# EasyEDA Pro project ProPrj_RUSH - SATURN - v8_2026-11-14.epro

# Board PCB1
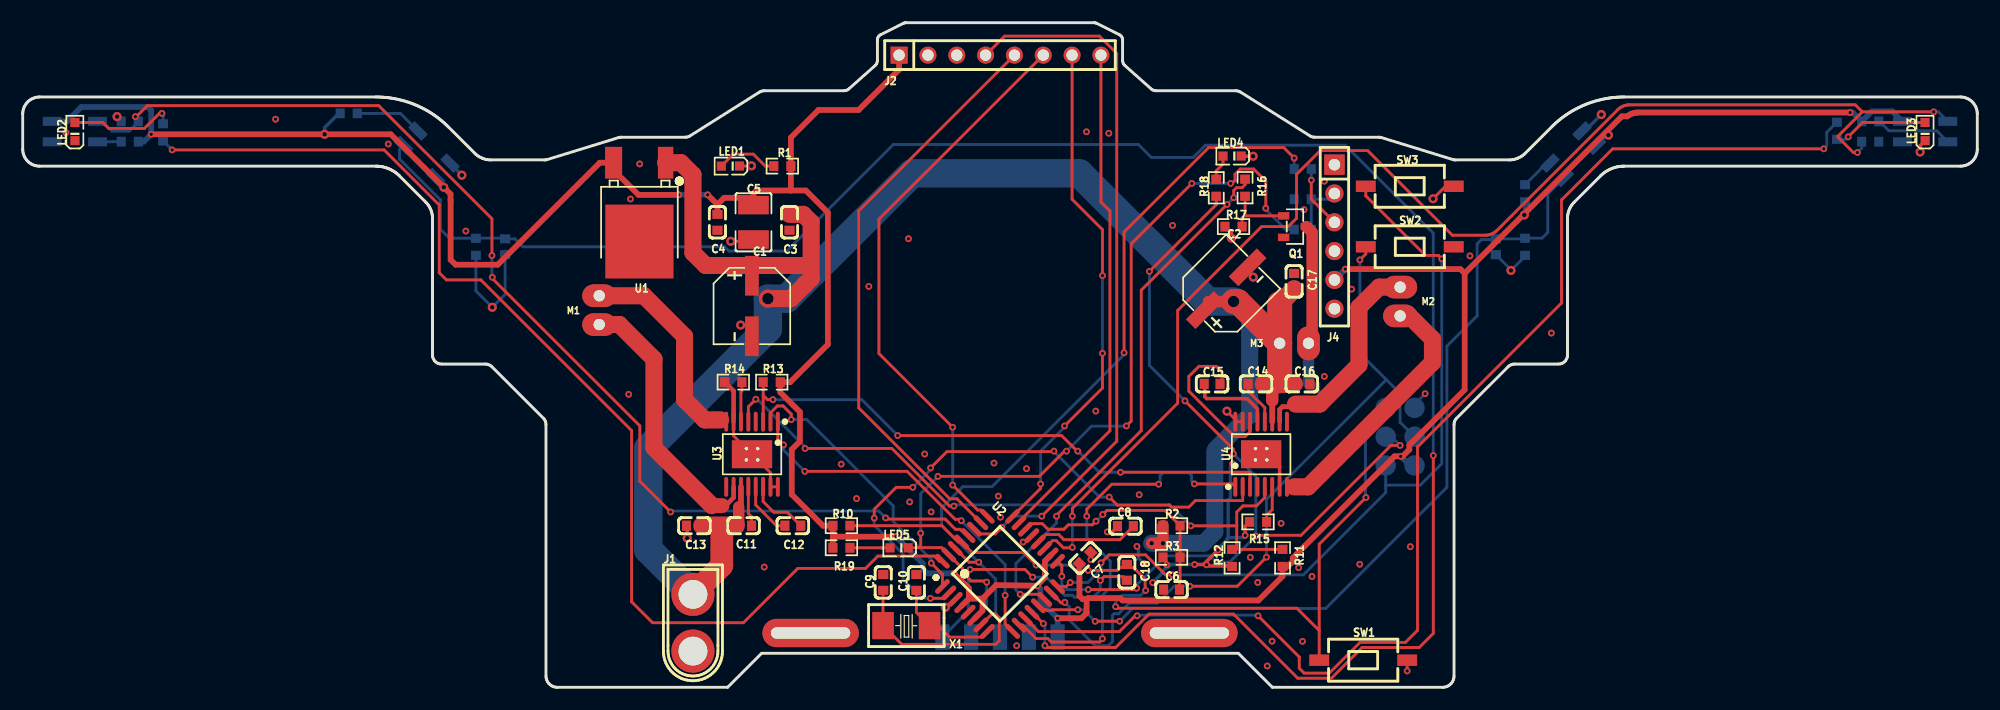
[diagram p0: board, top side]
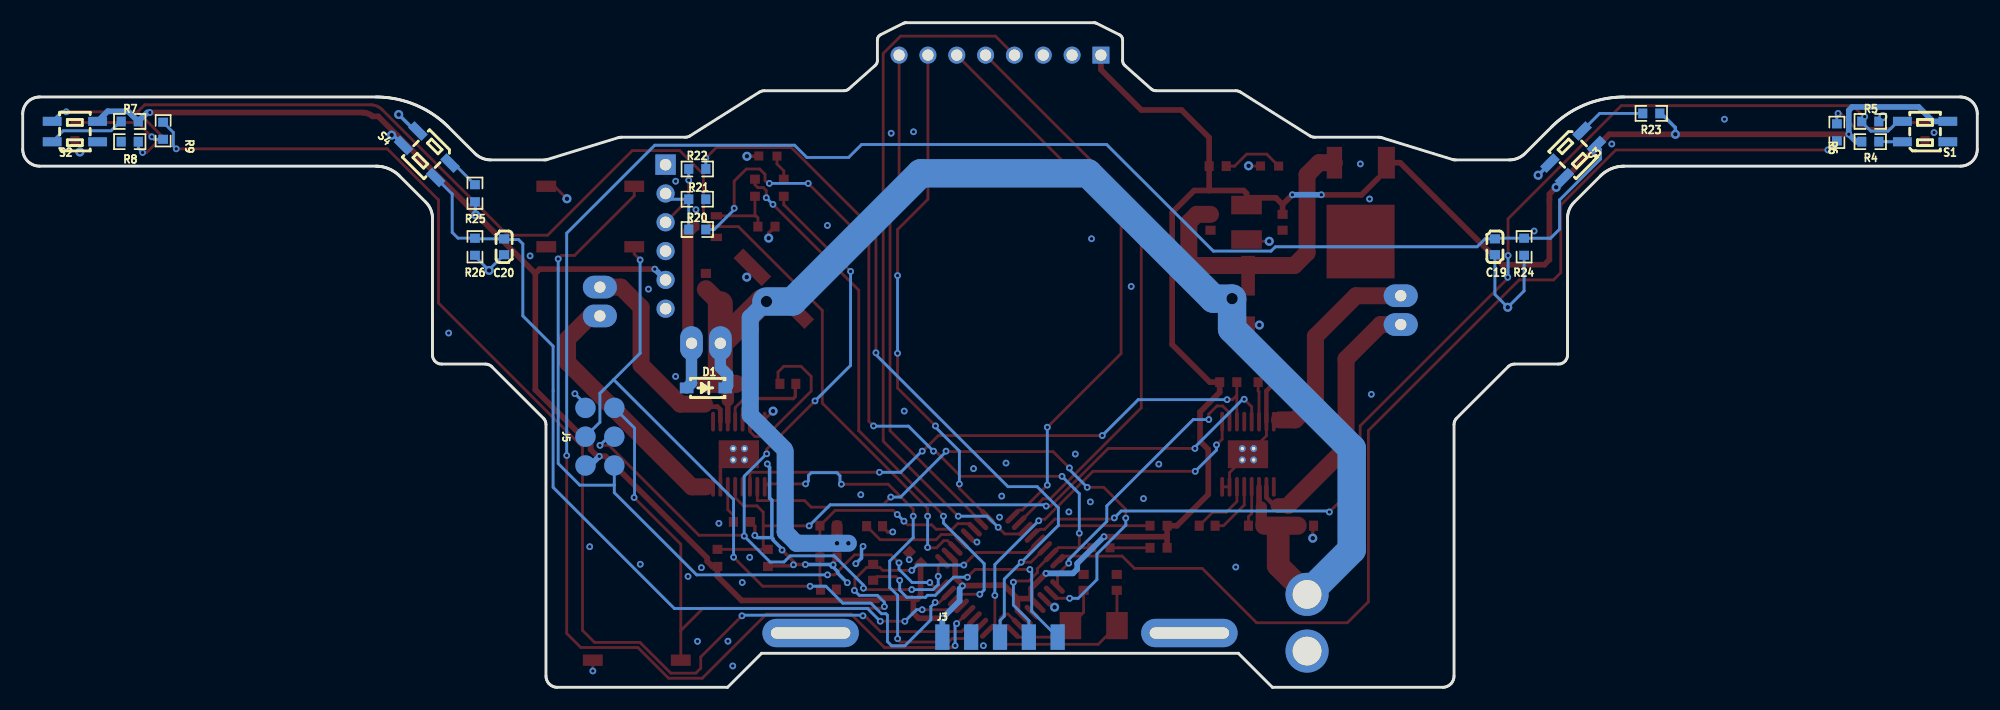
[diagram p1: board, bottom side, seen from below]

Outline 172.2 x 58.6 mm; copper layers: Top Layer, Bottom Layer. Coordinates in mm from the lower left corner of the outline.
Outline path: 0,50.55 0.01,50.7 0.03,50.84 0.06,50.99 0.11,51.12 0.18,51.26 0.25,51.38 0.34,51.5 0.44,51.61 0.55,51.71 0.67,51.8 0.79,51.87 0.93,51.94 1.06,51.99 1.21,52.02 1.35,52.04 1.5,52.05 31.12,52.05 31.23,52.05 31.34,52.05 31.45,52.04 31.56,52.04 31.67,52.03 31.78,52.03 31.89,52.02 32,52.01 32.11,52 32.22,51.98 32.33,51.97 32.44,51.95 32.55,51.94 32.66,51.92 32.77,51.9 32.88,51.88 32.99,51.85 33.1,51.83 33.21,51.81 33.31,51.78 33.42,51.75 33.53,51.72 33.64,51.69 33.74,51.66 33.85,51.63 33.95,51.59 34.06,51.56 34.16,51.52 34.27,51.48 34.37,51.44 34.48,51.4 34.58,51.36 34.68,51.32 34.78,51.27 34.88,51.23 34.98,51.18 35.08,51.13 35.18,51.08 35.28,51.03 35.38,50.98 35.48,50.93 35.58,50.87 35.67,50.82 35.77,50.76 35.86,50.7 35.96,50.65 36.05,50.59 36.14,50.53 36.23,50.46 36.33,50.4 36.42,50.33 36.51,50.27 36.59,50.2 36.68,50.13 36.77,50.07 36.86,50 36.94,49.92 37.03,49.85 37.11,49.78 37.19,49.71 37.27,49.63 37.35,49.55 37.43,49.48 37.51,49.4 39.83,47.09 39.92,47 40.02,46.91 40.13,46.84 40.24,46.77 40.36,46.71 40.48,46.65 40.6,46.61 40.72,46.57 40.85,46.54 40.98,46.52 41.11,46.5 41.24,46.5 45.98,46.5 46.1,46.51 46.21,46.53 52.49,48.47 52.6,48.49 52.72,48.5 58.37,48.5 58.52,48.51 58.66,48.56 58.8,48.62 64.9,52.48 65.04,52.54 65.18,52.59 65.33,52.6 72.37,52.6 72.52,52.62 72.65,52.67 72.77,52.75 75.1,54.82 75.21,54.95 75.28,55.1 75.3,55.27 75.3,57.09 75.33,57.27 75.43,57.43 75.58,57.54 77.59,58.55 77.7,58.59 77.82,58.6 94.38,58.6 94.5,58.59 94.61,58.55 96.62,57.54 96.77,57.43 96.87,57.27 96.9,57.09 96.9,55.27 96.92,55.1 96.99,54.95 97.1,54.82 99.43,52.75 99.55,52.67 99.68,52.62 99.83,52.6 106.87,52.6 107.02,52.59 107.16,52.54 107.3,52.48 113.4,48.62 113.54,48.56 113.68,48.51 113.83,48.5 119.48,48.5 119.6,48.49 119.72,48.47 125.98,46.53 126.1,46.51 126.22,46.5 130.96,46.5 131.09,46.5 131.22,46.52 131.35,46.54 131.48,46.57 131.6,46.61 131.72,46.65 131.84,46.71 131.96,46.77 132.07,46.84 132.18,46.91 132.28,47 132.37,47.09 134.69,49.4 134.76,49.48 134.84,49.55 134.93,49.63 135.01,49.71 135.09,49.78 135.17,49.85 135.26,49.92 135.34,50 135.43,50.07 135.52,50.13 135.61,50.2 135.69,50.27 135.78,50.33 135.87,50.4 135.97,50.46 136.06,50.53 136.15,50.59 136.24,50.65 136.34,50.7 136.43,50.76 136.53,50.82 136.62,50.87 136.72,50.93 136.82,50.98 136.92,51.03 137.02,51.08 137.12,51.13 137.22,51.18 137.32,51.23 137.42,51.27 137.52,51.32 137.62,51.36 137.72,51.4 137.83,51.44 137.93,51.48 138.04,51.52 138.14,51.56 138.25,51.59 138.35,51.63 138.46,51.66 138.56,51.69 138.67,51.72 138.78,51.75 138.89,51.78 138.99,51.81 139.1,51.83 139.21,51.85 139.32,51.88 139.43,51.9 139.54,51.92 139.65,51.94 139.76,51.95 139.87,51.97 139.98,51.98 140.09,52 140.2,52.01 140.31,52.02 140.42,52.03 140.53,52.03 140.64,52.04 140.75,52.04 140.86,52.05 140.97,52.05 141.09,52.05 170.7,52.05 170.85,52.04 170.99,52.02 171.14,51.99 171.27,51.94 171.41,51.87 171.53,51.8 171.65,51.71 171.76,51.61 171.86,51.5 171.95,51.38 172.02,51.26 172.09,51.12 172.14,50.99 172.17,50.84 172.19,50.7 172.2,50.55 172.2,47.45 172.19,47.3 172.17,47.16 172.14,47.01 172.09,46.88 172.02,46.74 171.95,46.62 171.86,46.5 171.76,46.39 171.65,46.29 171.53,46.2 171.41,46.13 171.27,46.06 171.14,46.01 170.99,45.98 170.85,45.96 170.7,45.95 141.09,45.95 141.03,45.95 140.95,45.95 140.88,45.94 140.81,45.94 140.7,45.92 140.59,45.91 140.5,45.89 140.39,45.87 140.29,45.84 140.21,45.82 140.1,45.78 140,45.74 139.91,45.71 139.81,45.66 139.72,45.61 139.62,45.56 139.53,45.5 139.46,45.46 139.37,45.4 139.28,45.33 139.2,45.27 139.14,45.22 139.07,45.15 139,45.09 136.69,42.77 136.6,42.68 136.51,42.58 136.44,42.47 136.37,42.36 136.31,42.24 136.25,42.12 136.21,42 136.17,41.88 136.14,41.75 136.12,41.62 136.1,41.49 136.1,41.36 136.1,29.3 136.08,29.12 136.02,28.95 135.92,28.8 135.8,28.67 135.65,28.58 135.48,28.52 135.3,28.5 131.43,28.5 131.28,28.48 131.12,28.44 130.99,28.36 130.87,28.27 126.33,23.73 126.23,23.61 126.16,23.47 126.11,23.33 126.1,23.17 126.1,1 126.09,0.83 126.04,0.66 125.97,0.5 125.87,0.36 125.74,0.23 125.6,0.13 125.44,0.06 125.27,0.01 125.1,0 110.1,0 107.1,3 65.1,3 62.1,0 47.1,0 46.93,0.01 46.76,0.06 46.6,0.13 46.46,0.23 46.33,0.36 46.23,0.5 46.16,0.66 46.12,0.83 46.1,1 46.1,23.17 46.09,23.33 46.04,23.47 45.96,23.61 45.87,23.73 41.33,28.27 41.21,28.36 41.07,28.44 40.93,28.48 40.77,28.5 36.9,28.5 36.72,28.52 36.55,28.58 36.4,28.67 36.27,28.8 36.18,28.95 36.12,29.12 36.1,29.3 36.1,41.36 36.1,41.49 36.08,41.62 36.06,41.75 36.03,41.88 35.99,42 35.95,42.12 35.89,42.24 35.83,42.36 35.76,42.47 35.69,42.58 35.6,42.68 35.51,42.77 33.2,45.09 33.13,45.15 33.06,45.22 33,45.27 32.92,45.33 32.85,45.38 32.76,45.45 32.67,45.5 32.58,45.56 32.49,45.61 32.4,45.66 32.3,45.7 32.22,45.73 32.12,45.77 32.03,45.81 31.92,45.84 31.82,45.86 31.71,45.89 31.63,45.9 31.52,45.92 31.43,45.93 31.36,45.94 31.27,45.95 31.2,45.95 31.11,45.95 1.5,45.95 1.35,45.96 1.21,45.98 1.06,46.01 0.93,46.06 0.79,46.13 0.67,46.2 0.55,46.29 0.44,46.39 0.34,46.5 0.25,46.62 0.18,46.74 0.11,46.88 0.06,47.01 0.03,47.16 0.01,47.3 0,47.45 0,50.55
Stack: Top Layer 0.035mm / Dielectric1 1.51mm FR4 er 4.5 / Bottom Layer 0.035mm

## Design rules (mm)
spacing copperThickness1oz (default): track to track 0.2, other pairs 0.2 to 0.3
spacing copperThickness2oz: track to track 0.203, other pairs 0.152 to 0.3
spacing Plane_innerPlane: track to track 0.2, other pairs 0.2 to 0.3
spacing Copper_copperRegion: track to track 0.2, other pairs 0.2 to 0.3
track width copperThickness1oz (default): min 0.25, default 0.25, max 3
track width copperThickness2oz: min 0.203, default 0.254, max 2.54
differential pair differentialPair (default): width min 0.127, default 0.254, max 2.54; gap min 0.152, default 0.152
net GND uses Copper_copperRegion, Plane_innerPlane
pour e1803 uses Copper_copperRegion
pour e1804 uses Copper_copperRegion

## Placement (name value [footprint] x y rotation side)
C1  220uF  [CAP-SMD_BD6.3-L6.6-W6.6-FD]  64.24 33.62 270 top
C2  220uF  [CAP-SMD_BD6.3-L6.6-W6.6-FD]  106.02 35.14 45 top
C3  220nF  [C0603]  67.56 41 270 top
C4  100nF  [C0603]  61.21 41 270 top
C5  47uF  [C1210]  64.38 41 90 top
C6  100nF  [C0603]  101.21 8.62 180 top
C7  100nF  [C0603]  93.59 11.41 45 top
C8  100nF  [C0603]  97.15 14.2 180 top
C9  22pF  [C0603]  75.81 9.25 90 top
C10  22pF  [C0603]  78.73 9.25 90 top
C11  100nF  [C0603]  63.51 14.25 0 top
C12  22nF  [C0603]  67.85 14.25 0 top
C13  100nF  [C0603]  59.18 14.25 180 top
C14  100nF  [C0603]  108.66 26.75 180 top
C15  22nF  [C0603]  104.79 26.75 0 top
C16  100nF  [C0603]  112.69 26.75 0 top
C17  100nF  [C0603]  112.01 35.79 90 top
C18  100nF  [C0603]  97.28 10.14 90 top
C19  10nF  [C0603]  42.5 38.84 90 bottom
C20  10nF  [C0603]  129.79 38.84 90 bottom
D1  1N5819  [SOD-123_L2.7-W1.6-LS3.7-RD-1]  112.01 26.4 0 bottom
J1  XT30 (bateria 2S)  [CONN-TH_XT30U-M]  59.05 5.69 270 top
J2  BARRA (1x8, 2,54 mm)  [HDR-TH_8P-P2.54-V-M]  86.1 55.74 0 top
J3  -  [seguidor_alpha:HDR_1x05_P2.54_SMD_DEITADA]  86.1 4.43 0 bottom
J4  -  [HDR-TH_6P-P2.54-V-F]  115.56 39.73 270 top
J5  -  [seguidor_alpha:ICSP_6P_SMD_BOT]  121.35 22.1 0 bottom
LED1  verde  [LED0603-RD_GREEN]  62.35 45.96 180 top
LED2  LED A  [LED0603-RD_GREEN]  4.6 49 90 top
LED3  LED B  [LED0603-RD_GREEN]  167.6 49 90 top
LED4  LED C  [LED0603-RD_GREEN]  106.55 46.84 180 top
LED5  TX  [LED0603-RD_GREEN]  77.21 12.3 180 top
M1  1020 esq.  [seguidor_alpha:MOTOR_1020_2P]  50.79 33.25 0 top
M2  1020 dir.  [seguidor_alpha:MOTOR_1020_2P]  121.35 34.02 180 top
M3  ventoinha  [seguidor_alpha:MOTOR_1020_2P]  112.01 30.33 270 top
NOREF  -  [Pad_e303]  102.78 4.79 270 top
NOREF#2  -  [Pad_e304]  69.41 4.79 270 top
Q1  AO3400A  [SOT-23-3_L2.9-W1.3-P1.90-LS2.4-BR]  112.09 40.62 180 top
R1  1k  [R0603]  66.92 45.95 180 top
R2  -  [R0603]  101.21 14.25 0 top
R3  -  [R0603]  101.21 11.46 180 top
R4  220  [R0603]  9.43 48.11 180 bottom
R5  47k  [R0603]  9.43 49.89 180 bottom
R6  1k  [R0603]  12.37 48.93 90 bottom
R7  220  [R0603]  162.77 49.89 0 bottom
R8  47k  [R0603]  162.77 48.11 0 bottom
R9  1k  [R0603]  159.83 49.07 270 bottom
R10  10k  [R0603]  72.13 14.25 0 top
R11  15k 1%  [R0603]  110.99 11.41 90 top
R12  10k 1%  [R0603]  106.55 11.41 270 top
R13  10k  [R0603]  65.99 26.91 180 top
R14  1.5k 1%  [R0603]  62.6 26.91 180 top
R15  1.5k 1%  [R0603]  108.83 14.58 180 top
R16  200  [R0603]  107.69 44.05 270 top
R17  10k  [R0603]  106.67 40.62 180 top
R18  1k  [R0603]  105.15 44.04 90 top
R19  1k  [R0603]  72.13 12.3 0 top
R20  1k  [R0603]  112.77 40.37 0 bottom
R21  2k  [R0603]  112.77 43.03 180 bottom
R22  4.7k  [R0603]  112.77 45.7 0 bottom
R23  220  [R0603]  28.72 50.6 0 bottom
R24  47k  [R0603]  39.93 38.84 270 bottom
R25  220  [R0603]  132.36 43.56 90 bottom
R26  47k  [R0603]  132.36 38.84 270 bottom
S1  QRE1113GR  [OPTO-SMD_QRE1113GR]  4.6 49 180 bottom
S2  QRE1113GR  [OPTO-SMD_QRE1113GR]  167.6 49 180 bottom
S3  QRE1113GR  [OPTO-SMD_QRE1113GR]  35.6 47 315 bottom
S4  QRE1113GR  [OPTO-SMD_QRE1113GR]  136.6 47 45 bottom
SW1  RESET  [KEY-SMD_L6.1-W3.7-LS8.0-2]  118.1 2.39 180 top
SW2  BOTÃO 1  [KEY-SMD_L6.1-W3.7-LS8.0-2]  122.2 38.84 0 top
SW3  BOTÃO 2  [KEY-SMD_L6.1-W3.7-LS8.0-2]  122.2 44.18 0 top
U1  78M05  [TO-252-2_L6.5-W6.1-P4.58-LS10.0-TL]  54.35 42.78 270 top
U2  ATmega328P-AU  [TQFP-32_L7.0-W7.0-P0.80-LS9.0-BL]  86.1 10 315 top
U3  DRV8874PWPR  [HTSSOP-16_L5.0-W4.4-P0.65-LS6.4-BL-EP]  64.25 20.55 180 top
U4  DRV8874PWPR  [HTSSOP-16_L5.0-W4.4-P0.65-LS6.4-BL-EP]  109.11 20.55 0 top
X1  16MHz  [CRYSTAL-SMD_L5.0-W3.2]  77.84 5.44 0 top

## Footprints (pads in the part's own frame, mm; a bottom-side part is the same pattern mirrored in y, then rotated)
C0603
  rect 0.8x0.9 smd: 1(-0.7,0) 2(0.7,0)
C1210
  rect 1.635x2.7 smd: 1(-1.518,0) 2(1.518,0)
CAP-SMD_BD6.3-L6.6-W6.6-FD
  rect 3.5x1.2 smd: 1(-2.67,0) 2(2.67,0)
CONN-TH_XT30U-M
  round 3.8 hole 2.54: 1(-2.5,0) 2(2.5,0)
CRYSTAL-SMD_L5.0-W3.2
  rect 1.9x2.4 smd: 1(-2.05,0) 2(2.05,0)
HDR-TH_6P-P2.54-V-F
  rect 1.8x1.8 hole 1.02: 1(-6.35,0)
  round 1.6 hole 1.02: 2(-3.81,0) 3(-1.27,0) 4(1.27,0) 5(3.81,0) 6(6.35,0)
HDR-TH_8P-P2.54-V-M
  rect 1.5x1.5 hole 1: 1(-8.89,0)
  round 1.5 hole 1: 2(-6.35,0) 3(-3.81,0) 4(-1.27,0) 5(1.27,0) 6(3.81,0) 7(6.35,0) 8(8.89,0)
HTSSOP-16_L5.0-W4.4-P0.65-LS6.4-BL-EP
  oval 0.343x1.746 smd: 1(-2.275,-2.873) 2(-1.625,-2.873) 3(-0.975,-2.873) 4(-0.325,-2.873) 5(0.325,-2.873) 6(0.975,-2.873) 7(1.625,-2.873) 8(2.275,-2.873) 9(2.275,2.873) 10(1.625,2.873) 11(0.975,2.873) 12(0.325,2.873) 13(-0.325,2.873) 14(-0.975,2.873) 15(-1.625,2.873) 16(-2.275,2.873)
  round 0.61 hole 0.305: 17(-0.5,0.5) 17(-0.5,-0.5) 17(0.5,0.5) 17(0.5,-0.5)
  rect 3.55x2.46 smd: 17(0,0)
KEY-SMD_L6.1-W3.7-LS8.0-2
  rect 1.75x1 smd: 1(-3.875,0) 2(3.875,0)
LED0603-RD_GREEN
  rect 0.8x0.8 smd: 1(-0.799,-0.004) 2(0.799,0.004)
OPTO-SMD_QRE1113GR
  rect 1.66x0.8 smd: 1(-2,-0.9) 2(2,-0.9) 3(2,0.9) 4(-2,0.9)
Pad_e303
  oval 2.5x8.5 hole 1x7: 1(0,0)
Pad_e304
  oval 2.5x8.5 hole 1x7: 1(0,0)
R0603
  rect 0.806x0.864 smd: 1(-0.753,0) 2(0.753,0)
seguidor_alpha:HDR_1x05_P2.54_SMD_DEITADA
  rect 1.25x2.25 smd: 1(5.08,0) 2(2.54,0) 3(0,0) 4(-2.54,0) 5(-5.08,0)
seguidor_alpha:ICSP_6P_SMD_BOT
  round 1.8 smd: 1(-1.27,2.54) 2(1.27,2.54) 3(-1.27,0) 4(1.27,0) 5(-1.27,-2.54) 6(1.27,-2.54)
seguidor_alpha:MOTOR_1020_2P
  oval 3x2 hole 1: 1(0,-1.27) 2(0,1.27)
SOD-123_L2.7-W1.6-LS3.7-RD-1
  rect 1.2x0.95 smd: 1(-1.7,0) 2(1.7,0)
SOT-23-3_L2.9-W1.3-P1.90-LS2.4-BR
  rect 1x0.65 smd: 1(1,-0.95) 2(1,0.95) 3(-1,0)
TO-252-2_L6.5-W6.1-P4.58-LS10.0-TL
  rect 2.8x1.35 smd: 1(-3.475,2.29)
  rect 6.5x6 smd: 2(3.475,-0.017)
  rect 2.8x1.5 smd: 3(-3.475,-2.29)
TQFP-32_L7.0-W7.0-P0.80-LS9.0-BL
  oval 0.45x1.65 smd: 1(-2.8,-4.369) 2(-2,-4.369) 3(-1.2,-4.369) 4(-0.4,-4.369) 5(0.4,-4.369) 6(1.2,-4.369) 7(2,-4.369) 8(2.8,-4.369) 17(2.8,4.369) 18(2,4.369) 19(1.2,4.369) 20(0.4,4.369) 21(-0.4,4.369) 22(-1.2,4.369) 23(-2,4.369) 24(-2.8,4.369)
  oval 1.65x0.45 smd: 9(4.381,-2.8) 10(4.381,-2) 11(4.381,-1.2) 12(4.381,-0.4) 13(4.381,0.4) 14(4.381,1.2) 15(4.381,2) 16(4.381,2.8) 25(-4.381,2.8) 26(-4.381,2) 27(-4.381,1.2) 28(-4.381,0.4) 29(-4.381,-0.4) 30(-4.381,-1.2) 31(-4.381,-2) 32(-4.381,-2.8)

## Nets
+5V: C4.1 C5.2 C7.1 J2.1 J3.1 J4.5 J5.2 R1.1 R4.1 R7.1 R10.1 R11.1 R13.1 R19.1 R23.1 R25.1 S1.3 S2.3 S3.3 S4.3 U1.3 U2.4 U2.6 U2.18
GND: C1.2 C2.2 C3.2 C4.2 C5.1 C6.2 C7.2 C8.2 C9.2 C10.2 C13.2 C16.2 C17.2 C19.1 C20.1 J1.2 J2.2 J3.2 J4.4 J5.6 LED1.1 LED2.1 LED3.1 LED4.1 Q1.2 R3.2 R5.2 R8.2 R12.2 R14.2 R15.2 R17.2 R21.2 R24.2 R26.2 S1.2 S2.2 S3.2 S4.2 SW1.1 SW2.2 SW3.2 U1.2 U2.3 U2.5 U2.21 U3.7 U3.9 U3.15 U3.16 U3.17 U4.7 U4.9 U4.15 U4.16 U4.17
VBAT: C1.1 C2.1 C3.1 C11.1 C13.1 C14.1 C16.1 C17.1 D1.1 J1.1 M3.1 R2.1 U1.1 U3.11 U4.11
VBAT_A7: C6.1 R2.2 R3.1 U2.22
AREF: C8.1 U2.20
B1_D11: J5.4 SW2.1 U2.15
B2_D12: J5.1 SW3.1 U2.16
BT_RXD: J4.2 R20.2 R21.1
BT_TXD: J4.3 R22.2
C0_A4: J2.4 U2.27
CPH_A: C12.1 U3.13
CPH_B: C15.1 U4.13
CPL_A: C12.2 U3.14
CPL_B: C15.2 U4.14
DIRA_D3: U2.1 U3.2
DIRB_D4: U2.2 U4.2
DRV_SLEEP: R13.2 U3.3 U4.3
DTR: C18.1 J3.5
IPROPI_A: R14.1 U3.6
IPROPI_B: R15.1 U4.6
LEDA_D2: R6.1 U2.32
LEDB_D7: R9.1 U2.11
LEDC_D13: J5.3 R18.1 U2.17
MARK_L2_D8: C19.2 R24.1 S3.4 U2.12
MARK_L_A5: R5.1 S1.4 U2.28
MARK_R2_D9: C20.2 R26.1 S4.4 U2.13
MARK_R_A6: R8.1 S2.4 U2.19
OUT_A1: M1.2 U3.8
OUT_A2: M1.1 U3.10
OUT_B1: M2.2 U4.8
OUT_B2: M2.1 U4.10
OUT_C: D1.2 M3.2 Q1.3
PWMA_D5: U2.9 U3.1
PWMB_D6: U2.10 U4.1
PWMC_D10: R16.1 U2.14
QRE_D1_A: R25.2 S4.1
QRE_E1_A: R23.2 S3.1
RESET: C18.2 J5.5 R10.2 SW1.2 U2.29
RX_D0: J3.3 R22.1 U2.30
S0_A0: J2.8 U2.23
S1_A1: J2.7 U2.24
S2_A2: J2.6 U2.25
S3_A3: J2.5 U2.26
TX_D1: J3.4 LED5.1 R20.1 U2.31
VCP_A: C11.2 U3.12
VCP_B: C14.2 U4.12
VREF: R11.2 R12.1 U3.5 U4.5
XTAL1: C9.1 U2.7 X1.1
XTAL2: C10.1 U2.8 X1.2
$1N2280: R4.2 S1.1
$1N2301: R7.2 S2.1
$1N2302: LED1.2 R1.2
$1N2305: LED2.2 R6.2
$1N2314: LED3.2 R9.2
$1N2361: LED4.2 R18.2
$1N2362: LED5.2 R19.2
$1N2451: Q1.1 R16.2 R17.1

Pads without a net: J2 3; J4 1 6; NOREF 1; NOREF#2 1; U3 4; U4 4

## Via types
v1: diameter 1.6, hole 1, Top Layer to Bottom Layer, 2 vias
v2: diameter 0.8, hole 0.4, Top Layer to Bottom Layer, 22 vias
v3: diameter 0.6, hole 0.3, Top Layer to Bottom Layer, 160 vias

## Routing (per net, layer and track width the routed paths; a pad name or vN(x,y) marks a point on that pad's centre or on a via; arc(x,y) is an arc through that point)
+5V: length 298.2
  Top Layer w0.5: 52.77,44.9 54.26,43.41 57.78,43.41 v3(57.79,43.43) ; 127.04,36.5 127.04,26.24 122.16,21.36 122.16,20.96 121.57,20.37 v3(121.4,20.37) 120.85,20.37 111.89,11.4 111.89,11.11 111.44,10.66 R11.1 110.99,9.79 108.86,7.66 96.9,7.66 96.69,7.86 93.86,7.86 93.76,7.76 93.73,7.76 ; 127.04,36.5 140.88,50.34 141.36,50.34 141.48,50.43 141.61,50.5 141.74,50.57 141.88,50.62 142.02,50.65 142.17,50.67 142.32,50.68 161,50.68 ; 127.04,36.5 126.67,36.87 v3(116.51,36.87) ; 89.37,8.98 89.34,8.95 85.75,9.01 84.56,7.82 ; 89.37,8.98 v3(89.41,8.94) ; 89.37,8.98 90.05,9.67 90.05,11.12 U2.18 ; 71.38,13.28 R10.1 70.51,14.25 67.75,17 67.75,20.97 68.47,21.69 68.47,24.28 66.74,26.01 R13.1 67.61,26.91 70.93,30.23 70.93,41.87 69,43.8 67.68,43.8 ; 71.38,13.28 v3(76.94,13.28) ; 71.38,13.28 R19.1 ; 64.38,43.16 64.38,43.55 64.64,43.8 67.68,43.8 ; 64.38,43.16 61.8,43.16 61.21,42.57 C4.1 ; 64.38,43.16 64.38,42.52 ; v3(82.05,10.05) 82.05,10.04 83.35,8.74 83.35,7.82 ; J2.1 77.21,54.46 73.65,50.91 70.11,50.91 67.68,48.47 R1.1 67.68,43.8 ; U1.3 50.84,46.25 41.85,37.26 ; 84.56,7.82 84.56,6.76 U2.6 ; 84.56,7.82 83.35,7.82 ; 93.73,7.76 93.39,7.76 93.1,8.05 C7.1 ; 93.73,7.76 93.73,6.6 93.71,6.57 93.71,6.53 93.27,6.09 v3(91.18,6.09) ; 83.35,7.82 U2.4 ; v3(60.34,43.43) 61.07,42.7 ; 11.32,48.76 v2(26.6,48.76) 32.43,48.76 v2(37.1,44.09) 37.69,43.49 37.69,43.01 37.7,42.86 37.7,37.7 38.14,37.26 41.85,37.26
  Bottom Layer w0.3: v2(26.6,48.76) 26.6,49.35 27.85,50.6 ; v2(139.7,48.69) 139.56,48.69 138.65,47.78 ; 36.38,44.95 37.1,44.23 v2(37.1,44.09) ; v2(132.29,41.65) 132.32,41.68 132.32,42.67
  Bottom Layer w0.5: v3(76.94,13.28) 79.3,10.92 79.3,10.42 79.67,10.05 v3(82.05,10.05) ; v3(116.51,36.87) J4.5 ; S2.3 164.71,50.79 162.92,50.79 R7.1 161.23,50.68 v3(161,50.68) ; J5.2 122.21,19.56 v3(121.4,20.37) ; v3(89.41,8.94) 89.66,8.7 89.66,7.61 v3(91.18,6.09) J3.1 ; R4.1 10.67,48.11 v3(11.32,48.76) 11.32,50.87 11.02,51.17 5.16,51.17 3.9,49.9 S1.3 ; v3(57.79,43.43) v3(60.34,43.43)
GND: length 64.8
  Top Layer w0.25: SW3.2 125.35,44.18 v2(124.25,43.08) ; C5.1 64.22,39.32 v2(62.38,39.32) ; v2(64.2,45.98) 64.18,45.96 63.15,45.96 ; 107.48,23.42 U4.16 106.83,23.61 v2(106.09,24.35) ; U3.16 U3.15 65.88,18.92 U3.17 U3.17 U3.17 62.63,22.17 U3.7 ; v3(121.97,1.44) SW1.1
  Top Layer w0.3: v3(107.7,13.4) 107.7,14.21 R15.2 ; 110.73,18.45 110.73,19.52 ; 106.15,10.7 104.55,10.7 ; R17.2 106.48,40.06 v2(106.48,39.61) ; v2(167.16,47.2) 167.16,47.76 167.25,47.85 ; 96.1,13.8 96,13.7 v3(95.55,13.7) ; v3(103.25,10.83) 104.03,10.83 v3(105.3,12.1) ; 107.7,46.82 v2(108.4,46.82) ; 58.55,13.85 v2(58.55,13.15)
  Top Layer w0.4: R14.2 62.63,26.13 U3.7
  Bottom Layer w0.25: v3(123.55,25.89) 122.62,24.96 J5.6 ; R24.2 39.93,34.95 v2(41.37,33.51) 42.5,34.64 C19.1 ; C20.1 131.11,36.82 v2(131.11,36.76) 132.36,38 R26.2
  Bottom Layer w0.3: 106.5,19.5 106.4,19.4 106.4,16.7 106.2,16.5 106.2,13.2 106.1,13.1 106.1,13 105.3,12.2 v3(105.3,12.1) ; v2(38.69,45.15) 37.65,46.19 37.65,46.22 ; v3(98.8,10.9) 98.3,11.4 98.3,12.2 ; v3(99.55,9.22) 100.4,10.07 100.4,10.2 100.8,10.6 100.9,10.6 101.13,10.83 v3(103.25,10.83) ; 137.38,49.05 137.62,49.05 v2(139.07,50.5) ; 107.5,13.2 106.3,13.2
  vias: v2(8.31,50.32) v2(63.25,31.94) v2(81.29,7.06) v2(108.41,36.17) v3(3.81,48.91) v3(22.28,50.09) v3(32.2,47.9) v3(39.04,40.23) v3(53.39,25.83) v3(53.54,43.05) v3(54.35,46.15) v3(65.33,10.6) v3(72.11,19.68) v3(73.46,16.64) v3(74.54,35.35) v3(78.04,39.55) v3(78.14,16.35) v3(79.47,20.57) v3(80.03,15.47) v3(85.57,19.77) v3(85.95,16.86) v3(86.14,15) v3(87.56,3.67) v3(88.13,12.81) v3(88.43,19.28) v3(93.72,48.98) v3(94.1,11.25) v3(94.54,24.35) v3(95.69,48.85) v3(98.16,12.43) v3(98.36,16.98) v3(100.8,10.8) v3(101.3,40.72) v3(104.3,10.8) v3(106.6,19.7) v3(108.15,11.46) v3(108.81,9.25) v3(109.64,1.88) v3(110.07,4.07) v3(110.86,14.46) v3(112.41,10.55) v3(112.75,4.06) v3(112.89,42.11) v3(113.59,9.78) v3(114.67,44.62) v3(114.67,27.41) v3(117.07,35.11) v3(117.79,10.85) v3(122.25,12.4) v3(127.5,38.04) v3(134.67,31.24)
VBAT: length 185.1
  Top Layer w0.4: 110.08,25.3 110,25.3
  Top Layer w0.5: 63.28,14.72 C11.1 ; 63.08,15.9 63.28,16.1 U3.11 ; U4.11 110.08,25.3
  Top Layer w1: 63.08,14.25 63.08,15.9 ; R2.1 v2(100.46,12.7) v2(99.46,12.7) ; 104.47,34.02 v1(106.67,34.02)
  Top Layer w1.1: 110.08,25.3 110.08,26.75
  Top Layer w1.5: 67.56,41.7 68.76,41.7 69.46,41 69.46,36.05 68.95,35.53 ; 68.95,35.53 68.92,35.57 ; 68.95,35.53 67.69,34.27 v1(65.65,34.27) ; 69.21,37.19 60.17,37.19 59.05,38.31 59.05,45.19 57.99,46.25 U1.1
  Top Layer w1.6: C17.1 110.74,33.82 ; C14.1 C16.1 ; C13.1 C11.1
  Top Layer w2: J1.1 61.59,10.73 61.59,13.82
  Top Layer w2.2: M3.1 107.06,34.02 v1(106.67,34.02) ; M3.1 110.74,33.82 ; M3.1 110.74,27.03
  Bottom Layer w1: D1.1 110.1,26.6 110.1,27.56 110.74,28.2 M3.1
  Bottom Layer w1.5: 105.02,20.81 105.02,13.7 104.51,13.19 ; v2(99.46,12.7) v2(100.46,12.7) 104.03,12.7 104.26,12.93 ; 105.1,21 108.1,24 108.1,32.59 v1(106.67,34.02)
  Bottom Layer w2.5: J1.1 55.11,12.13 55.11,21.06 65.65,31.6 v1(65.65,34.27) 67.3,34.27 78.35,45.32 93.09,45.32 104.39,34.02 v1(106.67,34.02)
VBAT_A7: length 20.9
  Top Layer w0.25: C6.1 101.91,9.41 101.97,9.46 R3.1 R2.2 100.62,15.6 95.51,15.6 v3(95.15,15.24) ; v3(94.56,14.65) 94.24,14.33 92.12,14.33 91.73,13.94 90.32,13.94 89.83,14.43 88.83,14.43 U2.22
  Bottom Layer w0.25: v3(95.15,15.24) v3(94.56,14.65)
AREF: length 9.3
  Top Layer w0.25: C8.1 96.66,13.02 91.72,13.02 91.27,13.47 90.14,13.47 U2.20
B1_D11: length 65.2
  Top Layer w0.25: U2.15 91.48,7.45 91.78,7.45 v3(91.81,7.49) ; v3(109.57,11.47) 107.01,8.91 v3(102.83,8.91) ; SW2.1 118.32,38.2 v3(117.81,37.68)
  Bottom Layer w0.25: 120.13,27.13 121.35,25.91 121.35,23.37 J5.4 ; 120.13,27.13 117.81,29.45 v3(117.81,37.68) ; 120.13,27.13 109.57,16.56 v3(109.57,11.47) ; v3(91.81,7.49) 92.2,7.1 92.2,5.95 94.48,3.66 95.64,3.66 96.01,4.03 96.01,6.35 96.15,6.49 96.54,6.49 97.47,7.42 99.94,7.42 101.44,8.91 v3(102.83,8.91)
B2_D12: length 70.1
  Top Layer w0.25: v3(101.3,9.91) 100.69,9.91 98.92,11.68 95.7,11.68 v3(95,10.97) ; SW3.1 118.32,43.33 123.58,38.08 124.72,38.08 v3(125.03,37.78) ; v3(92.29,9.24) 91.93,8.88 U2.16
  Bottom Layer w0.25: 120.08,17.82 J5.1 ; 120.08,17.82 120.08,17.17 112.82,9.91 v3(101.3,9.91) ; 120.08,17.82 123.12,17.82 125.02,19.72 125.02,37.77 v3(125.03,37.78) ; v3(95,10.97) 95,10.4 93.84,9.24 v3(92.29,9.24)
BT_RXD: length 4.9
  Bottom Layer w0.25: R20.2 R21.1 115.06,43.03 J4.2
BT_TXD: length 5.5
  Top Layer w0.25: J4.3 113.52,43.04 v3(113.52,44.72)
  Bottom Layer w0.25: v3(113.52,44.72) R22.2
C0_A4: length 63.2
  Top Layer w0.25: 83.85,13.95 84.27,13.52 85.67,13.52 v3(86.26,14.11) ; v3(89.78,15.09) 96.39,21.7 96.39,55.89 94.86,57.41 86.5,57.41 J2.4
  Bottom Layer w0.25: v3(89.78,15.09) 87.24,15.09 v3(86.26,14.11)
CPH_A: length 4.9
  Top Layer w0.25: 64.58,17.68 64.58,16.08 66.41,14.25 C12.1
CPH_B: length 7.4
  Top Layer w0.3: U4.13 108.78,24.54 107.87,25.46 104.31,25.46 104.13,25.63 104.13,26.71 C15.1
CPL_A: length 5.5
  Top Layer w0.25: C12.2 67.36,15.44 66.17,15.44 65.23,16.38 U3.14
CPL_B: length 14.1
  Top Layer w0.25: U4.14 108.13,22.54 107.69,22.11 106.75,22.11 102.74,26.11 102.74,27.41 103.63,28.3 105.15,28.3 105.66,27.79 105.66,26.8 105.61,26.75 C15.2
DIRA_D3: length 24.7
  Top Layer w0.25: v3(80.05,10.94) 81.03,9.96 81.03,8.89 ; v3(67.71,23.61) 67.71,24.09 66.99,24.81 66.49,24.81 65.88,24.2 U3.2
  Bottom Layer w0.25: v3(67.71,23.61) 69.08,23.61 76.69,15.99 76.69,14.62 80.05,11.27 v3(80.05,10.94)
DIRB_D4: length 50.3
  Top Layer w0.25: v3(95.72,16.77) 96.43,16.07 101.02,16.07 101.2,15.89 102.74,15.89 103.31,16.46 107.47,16.46 107.48,16.48 107.48,17.68 ; v3(78.42,17.63) 76.95,17.63 75.02,15.69 v3(75.02,14.92) ; v3(79.96,7.85) 81.12,7.85 U2.2 ; 90.85,20.78 81.42,20.78 v3(79.99,19.34)
  Bottom Layer w0.25: v3(75.02,14.92) 75.02,14.29 77.56,11.75 77.56,9.5 79.21,7.85 v3(79.96,7.85) ; v3(78.42,17.63) 79.99,19.2 v3(79.99,19.34) ; v3(95.72,16.77) 94.86,16.77 90.85,20.78
  vias: v3(90.85,20.82)
DRV_SLEEP: length 50.4
  Top Layer w0.25: U4.3 108.13,18.89 108.06,18.96 96.72,18.96 v3(96.72,18.96) ; U3.3 65.24,23.43 65.24,25.74 ; v3(77.09,22.2) 91.53,22.2 92.87,20.86 92.95,20.86 ; 65.24,25.74 R13.2 ; 65.24,25.74 65.62,25.36 v3(66.09,25.36)
  Bottom Layer w0.25: 92.95,20.86 94.85,18.96 v3(96.72,18.96) ; v3(66.09,25.36) 73.92,25.36 v3(77.09,22.2)
  vias: v3(92.95,20.82)
DTR: length 23.2
  Top Layer w0.25: v3(83.47,10.39) 83.48,10.39 88.3,10.39 v3(88.98,9.71) ; v3(94.94,9.43) 95.27,9.76 96.96,9.76 C18.1
  Bottom Layer w0.25: v3(94.94,9.43) 94.94,8.56 94.31,7.93 92.67,7.93 92.49,8.11 91.79,8.11 90.19,9.71 v3(88.98,9.71) ; J3.5 83.31,6.71 83.31,10.22 v3(83.47,10.39)
IPROPI_A: length 3.5
  Top Layer w0.25: U3.6 63.28,26.06 63.36,26.13 R14.1
IPROPI_B: length 3.3
  Top Layer w0.25: 110.08,17.68 110.08,15.66 109.59,15.17 R15.1
LEDA_D2: length 101.2
  Top Layer w0.25: v3(13.16,47.38) 31.84,47.38 36.7,42.53 36.7,36.56 37.33,35.92 40.36,35.92 53.64,22.64 53.64,7.54 55.49,5.69 63.49,5.69 68.28,10.49 74.25,10.49 75.34,11.57 80.31,11.57 80.76,11.12 U2.32
  Bottom Layer w0.25: R6.1 v3(13.16,47.38)
LEDB_D7: length 110.9
  Top Layer w0.25: v3(158.67,47.48) 140.07,47.48 135.63,43.03 ; 135.57,34.95 135.57,33.88 122.88,21.19 122.88,5.02 121.82,3.96 117.82,3.96 115.11,1.25 112.9,1.25 112.47,1.68 112.47,2.67 v3(108.83,6.3) ; v3(98.18,6.3) 98.01,6.3 96.62,4.91 89.49,4.91 88.35,6.05
  Top Layer w0.254: 135.63,43.03 135.57,42.97 135.57,34.95
  Bottom Layer w0.25: v3(98.18,6.3) 98.24,6.36 108.78,6.36 v3(108.83,6.3) ; R9.1 158.93,48.93 158.93,47.74 v3(158.67,47.48)
LEDC_D13: length 75.9
  Top Layer w0.25: 105.15,43.29 105.15,42.56 v3(99.26,36.67) ; v3(106.66,20.59) 106.66,20.99 v3(102.4,25.25) ; 91.17,11.11 91.54,10.73 v3(91.54,9.79) ; v3(93.88,8.61) 98.01,8.61 v3(98.13,8.74) ; v3(121.34,21.33) 120.55,21.33 112.62,13.41 108.71,13.41 v3(108.63,13.33)
  Bottom Layer w0.25: v3(121.34,21.33) 120.58,22.1 J5.3 ; v3(93.88,8.61) 91.98,8.61 91.54,9.06 v3(91.54,9.79) ; v3(106.66,20.59) 108.63,18.61 v3(108.63,13.33) 106.35,11.05 105.12,11.05 104.58,11.59 100.71,11.59 98.13,9.01 v3(98.13,8.74) ; v3(102.4,25.25) 99.26,28.39 v3(99.26,36.67)
MARK_L2_D8: length 183.5
  Top Layer w0.25: v3(124.27,20.44) 124.27,4.75 123.03,3.51 118,3.51 115.29,0.8 112.33,0.8 106.67,6.46 99.23,6.46 96.28,3.51 90.22,3.51 v3(90.06,3.68) ; v3(89.92,5.62) 88.92,6.62
  Bottom Layer w0.25: 39.93,39.6 42.5,39.6 ; v3(90.06,3.68) 90.06,5.48 v3(89.92,5.62) ; v3(124.27,20.44) 124.27,40.04 116.52,47.8 104.2,47.8 103.12,46.72 99.44,46.72 98.29,47.86 76.7,47.86 67.3,38.46 62.22,38.46 61.84,38.84 44.06,38.84 43.36,39.54 C19.2 ; R24.1 37.7,39.6
  Bottom Layer w0.254: 37.7,39.6 37.59,39.6 36.8,40.39 36.8,42.97 33.19,46.58 33.19,47.42 33.55,47.78
MARK_L_A5: length 97.7
  Top Layer w0.25: 9.92,50.23 10.98,51.29 31.36,51.29 41.34,41.31 v3(41.34,38.07) ; 41.27,36.15 54.37,23.05 54.37,18.17 v3(57.08,15.46) ; 82.67,13.83 82.57,13.93 82.17,13.93 81.27,14.83 76.13,14.83 v3(76.03,14.94)
  Bottom Layer w0.25: 7.37,49.53 7.87,49.03 9.37,49.03 9.87,49.53 ; v3(76.03,14.94) 75.42,15.55 57.17,15.55 v3(57.08,15.46) ; v3(41.34,38.07) 41.34,36.22 41.27,36.15
  vias: v3(9.92,50.32) v3(41.37,36.15)
MARK_R2_D9: length 76.2
  Top Layer w0.25: v3(96.65,5.83) 94.49,5.83 v3(94.48,5.82) ; 89.48,7.18 89.82,6.84 90.18,6.84 90.24,6.78 90.7,6.78 90.76,6.84 v3(92.96,6.84)
  Bottom Layer w0.25: v3(92.96,6.84) 93.46,6.84 v3(94.48,5.82) ; 125.47,30.08 128.14,32.75 128.14,39.1 128.52,39.48 129.72,39.48 C20.2 132.3,39.54 R26.1 132.36,39.6 133.85,39.6 134.36,40.11 134.36,43.49 S4.4 ; 96.65,5.83 97.77,6.95 114.79,6.95 125.47,17.63 ; 125.47,26.14 125.47,17.63
  Bottom Layer w0.254: 125.47,30.08 125.47,26.14 ; 132.29,39.33 132.31,39.35
MARK_R_A6: length 118.5
  Top Layer w0.25: 125.95,39.86 118.49,47.32 114.32,47.32 112.23,45.23 112.23,41.36 111.49,40.62 109.15,40.62 101.75,33.23 101.75,25.05 92.47,15.77 92.47,14.98 ; 162.07,50.74 161.45,51.36 ; 162.07,50.74 v3(168.36,50.74) ; 162.07,50.74 159.93,48.6 159.93,48.5 161.28,47.15 v3(161.64,47.15) ; U2.19 90.73,12.93 91.05,12.93 91.69,12.3 92.44,12.3 v3(92.47,12.33)
  Top Layer w0.254: 125.96,39.86 128.84,39.86 128.99,39.87 129.13,39.89 129.27,39.92 129.41,39.97 129.55,40.04 129.67,40.11 129.79,40.2 129.9,40.3 140.52,50.92 140.63,51.02 140.75,51.11 140.87,51.18 141.01,51.25 141.15,51.3 141.29,51.33 141.43,51.35 141.58,51.36 161.45,51.36
  Bottom Layer w0.25: v3(161.64,47.15) 162.02,47.53 R8.1 ; v3(92.47,12.33) 92.47,14.98 ; v3(168.36,50.74) 168.76,50.74 S2.4
  vias: v3(92.47,15.09)
OUT_A1: length 18.5
  Top Layer w1.5: 61.48,23.58 60.09,23.58 58.31,25.36 58.31,30.94 54.73,34.52 M1.2
OUT_A2: length 23.9
  Top Layer w0.4: U3.10 62.63,16.73 61.97,16.07
  Top Layer w1.3: 61.61,16.02 60.71,16.02
  Top Layer w1.5: 55.61,28.94 55.61,21.12 60.71,16.02 ; 55.62,28.94 52.57,31.98 M1.1
OUT_B1: length 22.5
  Top Layer w1.5: M2.2 122.17,32.75 124.2,30.71 124.2,28.63 113.24,17.68 112.01,17.68
OUT_B2: length 19
  Top Layer w0.41: 110.74,23.43 110.74,24.49 110.99,24.75 112.09,24.75
  Top Layer w1.5: M2.1 119.5,35.29 117.72,33.51 117.72,28.43 114.26,24.97 112.13,24.97
OUT_C: length 14.7
  Top Layer w1: M3.2 113.6,30.66 113.6,40.11 Q1.3
  Bottom Layer w1: M3.2 113.28,26.83 D1.2
PWMA_D5: length 32.6
  Top Layer w0.25: v3(82.69,14.69) 82.56,14.82 82.14,14.82 77.92,19.04 v3(68.9,19.04) ; v3(67.03,21.38) 66.53,21.88 U3.1 ; U2.9 86.55,5.59 v3(86.55,8.11)
  Bottom Layer w0.25: v3(86.55,8.11) 86.55,10.82 v3(82.69,14.69) ; v3(67.03,21.38) 67.03,20.92 v3(68.9,19.04)
PWMB_D6: length 36.3
  Top Layer w0.25: U2.10 88.09,5.49 89.27,4.3 90.31,4.3 90.62,3.99 94.89,3.99 95.12,4.22 v3(95.12,4.29) ; v3(103.22,17.94) 106.57,17.94 U4.1 ; 93.75,14.99 93.75,15.7 95.95,17.91 v3(100.08,17.91)
  Bottom Layer w0.25: 93.75,14.99 93.75,13.2 95.82,11.13 95.82,8.81 95.12,8.11 v3(95.12,4.29) ; v3(100.08,17.91) 100.2,18.03 100.2,18.65 100.47,18.92 102.72,18.92 102.97,18.67 102.97,18.19 v3(103.22,17.94)
  vias: v3(93.75,15.09)
PWMC_D10: length 47.8
  Top Layer w0.25: v3(106.1,42.58) 98.54,35.02 98.54,22.63 91.08,15.17 v3(91.08,15.09) ; U2.14 89.59,8.2 v3(87.88,8.2) ; R16.1 107.69,44.31 107.44,44.06 106.94,44.06 106.69,43.8 v3(106.69,43.17)
  Bottom Layer w0.25: v3(91.08,15.09) 91.08,14.48 87.5,10.9 87.5,8.59 v3(87.88,8.2) ; v3(106.69,43.17) v3(106.1,42.58)
QRE_D1_A: length 3
  Bottom Layer w0.25: S4.1 134.26,46.22 R25.2
QRE_E1_A: length 6.1
  Bottom Layer w0.254: 34.82,49.05 33.27,50.6 29.35,50.6
RESET: length 76.4
  Top Layer w0.25: v3(118.34,16.74) 114.22,12.62 114.22,5.01 ; v3(98.93,8.54) 98.89,8.59 98.89,9.54 97.86,10.56 97.28,10.56 ; v3(96.29,7.11) 96.43,6.97 112.25,6.97 114.22,5.01 ; 114.22,5.01 SW1.2 ; 97.28,10.56 96.69,10.56 96.43,10.31 v3(93.87,10.31) ; 97.28,10.56 C18.2 ; v3(89.29,10.78) 88.18,11.89 83.65,11.89 82.72,12.81 82.42,12.81 80.98,14.25 R10.2
  Bottom Layer w0.25: v3(118.34,16.74) 118.3,16.78 118.3,22.86 J5.5 ; v3(96.29,7.11) 96.29,7.5 96.89,8.11 98.5,8.11 v3(98.93,8.54) ; v3(89.29,10.78) 93.4,10.78 v3(93.87,10.31)
RX_D0: length 68
  Top Layer w0.25: v3(84.23,11.03) 83.37,11.03 82.15,12.25 ; v3(112.02,46.67) 111.09,47.59 104.48,47.59 97.03,40.14 v3(97.03,29.5)
  Bottom Layer w0.25: R22.1 v3(112.02,46.67) ; v3(97.03,29.5) 97.03,29.33 85.4,17.69 82.83,17.69 80.96,15.82 80.96,14.28 84.2,11.03 v3(84.23,11.03) 85.72,9.54 85.72,6.27 86.1,5.89 J3.3
S0_A0: length 44.9
  Top Layer w0.25: J2.8 94.99,42.78 95.79,41.98 95.79,22.62 87.78,14.61 U2.23
S1_A1: length 45.1
  Top Layer w0.25: J2.7 92.45,43.03 95.13,40.36 v3(95.13,36.3) ; v3(89.68,17.93) 89.68,17.54 87.21,15.07 ; v3(91.79,23.05) 95.13,26.39 v3(95.13,29.45)
  Bottom Layer w0.25: v3(91.79,23.05) 91.79,22.94 89.68,20.83 v3(89.68,17.93) ; v3(95.13,36.3) v3(95.13,29.45)
S2_A2: length 50.8
  Top Layer w0.25: U2.25 84.43,15.63 84.13,15.63 v3(81.93,17.83) ; v3(81.93,22.93) 75.43,29.43 75.43,41.26 J2.6
  Bottom Layer w0.25: v3(81.93,22.93) v3(81.93,17.83)
S3_A3: length 51.7
  Top Layer w0.25: J2.5 73.65,42.02 73.65,24.64 81.67,16.62 82.31,16.62 U2.26
TX_D1: length 76.5
  Top Layer w0.25: 78.01,12.3 78.75,12.3 78.77,12.32 79.11,12.32 ; 80.64,18.6 89.56,18.6 91.78,20.82 v3(91.96,20.82) ; v3(103,44.43) 97.66,39.09 97.66,23.46 v3(97.24,23.05) ; 79.11,12.32 v3(79.11,13.59) ; 79.11,12.32 80.95,12.32 U2.31 82.81,10.46 82.81,10.12 83.55,9.38 84.82,9.38 v3(84.92,9.27) ; v3(106.42,44.43) 106.55,44.43 106.8,44.68 106.8,45.23 107.27,45.7 108.45,45.7 109.52,44.63 v3(109.52,42.24)
  Bottom Layer w0.25: v3(109.52,42.24) 109.52,42.12 111.27,40.37 R20.1 ; v3(91.96,20.82) 94.16,23.03 97.24,23.03 ; v3(106.42,44.43) v3(103,44.43) ; J3.4 83.56,5.89 84.92,7.25 v3(84.92,9.27) ; v3(79.11,13.59) 79.11,17.08 v3(80.64,18.6)
VCP_A: length 3.5
  Top Layer w0.25: U3.12 63.93,15.33 64.21,15.04 C11.2
VCP_B: length 3.9
  Top Layer w0.25: 107.96,26.75 107.96,26.12 109.43,24.66 U4.12
VREF: length 61.1
  Top Layer w0.25: R12.1 106.96,12.16 ; 106.96,12.16 106.96,14.24 ; 106.96,12.16 R11.2 ; 106.96,14.24 106.96,15.45 107.5,16 108.7,16 109.43,16.73 U4.5 ; 106.96,14.24 v3(102.91,14.24) ; v3(82.03,15.98) 81.65,15.98 76.57,21.06 v3(68.93,21.06) ; v3(64.59,25.4) 63.93,24.74 U3.5
  Bottom Layer w0.25: v3(68.93,21.06) 68.93,21.18 64.71,25.4 v3(64.59,25.4) ; v3(82.03,15.98) 82.14,16.09 101.06,16.09 v3(102.91,14.24)
XTAL1: length 18.4
  Top Layer w0.25: U2.7 85.39,6.46 85.72,6.46 86.04,6.14 86.04,4.11 85.72,3.79 77.45,3.79 X1.1 75.79,8.54 C9.1
XTAL2: length 9.3
  Top Layer w0.25: C10.1 78.73,6.6 X1.2 80.64,5.44 81.66,4.43 84.48,4.43 84.99,4.93
$1N2280: length 2.1
  Bottom Layer w0.25: R4.2 7.93,48.11 7.92,48.1 S1.1
$1N2301: length 6.8
  Bottom Layer w0.25: R7.2 163.59,49.89 164.41,49.07 168.63,49.07 S2.1
$1N2302: length 5.5
  Top Layer w0.25: LED1.2 62.61,47.01 64.37,47.01 65.42,45.95 R1.2
$1N2305: length 9.4
  Top Layer w0.25: LED2.2 7.05,49.8 7.57,49.28 10.72,49.28 12.05,50.6 v3(12.27,50.6)
  Bottom Layer w0.25: R6.2 12.38,49.69 12.38,50.49 v3(12.27,50.6)
$1N2314: length 8.4
  Top Layer w0.25: v3(160.82,48.54) 162.09,49.8 LED3.2
  Bottom Layer w0.25: v3(160.82,48.54) 160.6,48.32 R9.2
$1N2361: length 2.3
  Top Layer w0.25: 105.15,44.8 105.15,45.54 105.75,46.14 LED4.2
$1N2362: length 3.5
  Top Layer w0.25: R19.2 75.66,12.3 75.67,12.3 76.41,12.3
$1N2451: length 6.2
  Top Layer w0.25: 107.69,41.57 R16.2 ; 107.69,41.57 107.6,41.57 107.43,41.39 R17.1 ; 107.69,41.57 Q1.1

## Copper pours and planes (outline as drawn; the poured copper is in the pictures)
GND on Top Layer: -5.21,60.43 173.86,60.43 173.86,-1.8 -5.21,-1.8
GND on Bottom Layer: -8.13,61.96 178.05,61.96 178.05,-5.35 -8.13,-5.35
